# Altium schematic sheet 03.Communicate.SchDoc: 03.Communicate
size A4; Organization: Altium Limited; Address1: L3, 12a Rodborough Rd; Address2: Frenchs Forest; Address3: NSW; Address4: Australia 2086; Revision: V1; SheetNumber: 4; SheetTotal: 6; Project: CH32V307VCT6
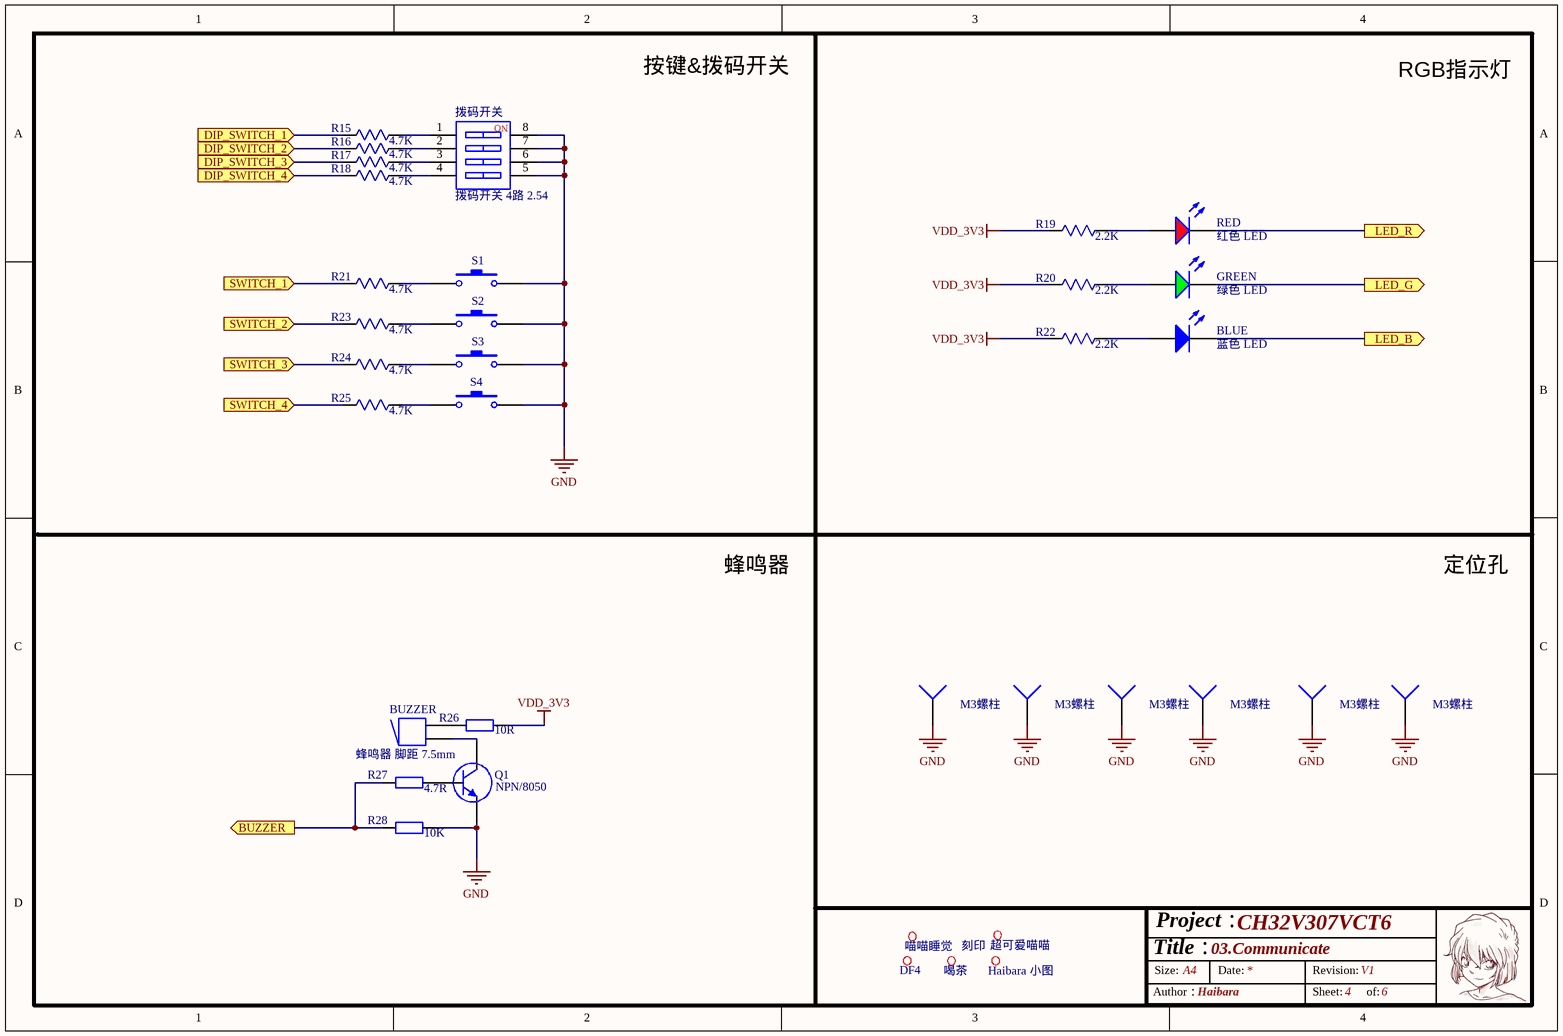
[diagram p0: 03.Communicate.SchDoc]

## Parts
(Parts that share a designator on the sheet are numbered #1, #2 ... from top to bottom, then left to right.)
?#1  喵喵睡觉  [喵喵睡觉]
?#2  超可爱喵喵  [喵喵]
?#3  刻印  [刻印]
?#4  DF4  [DF4小]
?#5  Haibara 小图  [Haibara小图丝印]
?#6  喝茶  [喝茶]
BLUE  蓝色 LED  [0603 LED B]
BUZZER  蜂鸣器 脚距 7.5mm  [蜂鸣器5.5mm脚距]
GREEN  绿色 LED  [0603 LED G]
J1  M3螺柱  [MTGP720H320V6P - duplicate]
J2  M3螺柱  [MTGP720H320V6P - duplicate]
J3  M3螺柱  [MTGP720H320V6P - duplicate]
J4  M3螺柱  [MTGP720H320V6P - duplicate]
J5  M3螺柱  [MTGP720H320V6P - duplicate]
J6  M3螺柱  [MTGP720H320V6P - duplicate]
Q1  NPN/8050  [SOT232-3 三极管]
R15  4.7K  [R0603]
R16  4.7K  [R0603]
R17  4.7K  [R0603]
R18  4.7K  [R0603]
R19  2.2K  [R0603]
R20  2.2K  [R0603]
R21  4.7K  [R0603]
R22  2.2K  [R0603]
R23  4.7K  [R0603]
R24  4.7K  [R0603]
R25  4.7K  [R0603]
R26  value 10R  [0603 电阻 R3]  (hidden comment: 4.7K)
R27  value 4.7R  [0603 电阻 R3]  (hidden comment: 4.7K)
R28  value 10K  [0603 电阻 R3]  (hidden comment: 4.7K)
RED  红色 LED  [0603 LED R]
S1  SW-PB  [TSW SMD-3*6*2.5]  (value not drawn)
S2  SW-PB  [TSW SMD-3*6*2.5]  (value not drawn)
S3  SW-PB  [TSW SMD-3*6*2.5]  (value not drawn)
S4  SW-PB  [TSW SMD-3*6*2.5]  (value not drawn)
拨码开关  拨码开关 4路 2.54  [CSW DIP-2P_G]

## Ports
BUZZER (out), DIP_SWITCH_1 (in), DIP_SWITCH_2 (in), DIP_SWITCH_3 (in), DIP_SWITCH_4 (in), LED_B (out), LED_G (out), LED_R (out), SWITCH_1 (in), SWITCH_2 (in), SWITCH_3 (in), SWITCH_4 (in)

## Nets
GND: J1.1 J2.1 J3.1 J4.1 J5.1 J6.1 Q1.2(E) R28.2 S1.2 S2.2 S3.2 S4.2 拨码开关.5 拨码开关.6 拨码开关.7 拨码开关.8
VDD_3V3: R19.1 R20.1 R22.1 R26.2
BUZZER: R27.1 R28.1 ; port BUZZER
DIP_SWITCH_1: R15.1 ; port DIP_SWITCH_1
DIP_SWITCH_2: R16.1 ; port DIP_SWITCH_2
DIP_SWITCH_3: R17.1 ; port DIP_SWITCH_3
DIP_SWITCH_4: R18.1 ; port DIP_SWITCH_4
LED_B: BLUE.2 ; port LED_B
LED_G: GREEN.2 ; port LED_G
LED_R: RED.2 ; port LED_R
SWITCH_1: R21.1 ; port SWITCH_1
SWITCH_2: R23.1 ; port SWITCH_2
SWITCH_3: R24.1 ; port SWITCH_3
SWITCH_4: R25.1 ; port SWITCH_4
NetBLUE_1: BLUE.1 R22.2
NetBUZZER_1: BUZZER.1 R26.1
NetBUZZER_2: BUZZER.2 Q1.3(C)
NetGREEN_1: GREEN.1 R20.2
NetQ1_1: Q1.1(B) R27.2
NetR15_2: R15.2 拨码开关.1
NetR16_2: R16.2 拨码开关.2
NetR17_2: R17.2 拨码开关.3
NetR18_2: R18.2 拨码开关.4
NetR19_2: R19.2 RED.1
NetR21_2: R21.2 S1.1
NetR23_2: R23.2 S2.1
NetR24_2: R24.2 S3.1
NetR25_2: R25.2 S4.1

## Notes on the sheet
- 按键&拨码开关
- RGB指示灯
- 蜂鸣器
- 定位孔
- Title：
- Size:
- Project：
- A4
- Date:
- Revision:
- Author：
- Haibara
- Sheet:
- of:
- (in symbol CSW-4P) NO

## Library data of the parts
BLUE = 蓝灯: 发光二极管; ComponentLink1Description: 供应商链接; ComponentLink1URL: http://www.szlcsc.com/product/details_2666.html; Package: 0805; Supplier: LC; SuppliersPartNumber: C2293
BUZZER = Buzzer: Magnetic Transducer Buzzer; Published: 24-Mar-1999; LatestRevisionDate: 17-Dec-2003; LatestRevisionNote: Schematic revised, PCB Footprint replaced.; DatasheetVersion: 17-Dec-2003; PackageReference: ABSM-1574; Publisher: Altium Limited; PackageDescription: Magnetic Transducer Buzzer; ComponentLink1Description: Manufacturer Link; ComponentLink1URL: http://www.megastar.com/linecard/buzzmode/index.php
GREEN = 绿灯: 发光二极管; ComponentLink1Description: 供应商链接; ComponentLink1URL: http://www.szlcsc.com/product/details_2670.html; Package: 0805; Supplier: LC; SuppliersPartNumber: C2297
J1-J6 = Socket: LatestRevisionDate: 17-Jul-2002; LatestRevisionNote: Re-released for DXP Platform.; Publisher: Altium Limited
R15-R25 = 电阻
R26-R28 = Res2: Resistor; Published: 8-Jun-2000; LatestRevisionDate: 17-Jul-2002; LatestRevisionNote: Re-released for DXP Platform.; PackageReference: AXIAL-0.4; Publisher: Altium Limited; PackageDescription: Axial Device, Thru-Hole; 2 Leads; 0.4 in Pin Spacing
RED = 红灯: 发光二极管; ComponentLink1Description: 供应商链接; ComponentLink1URL: http://www.szlcsc.com/product/details_2668.html; Package: 0805; Supplier: LC; SuppliersPartNumber: C2295
S1-S4 = SW-PB: Switch; Published: 24-Mar-1999; LatestRevisionDate: 17-Jul-2002; LatestRevisionNote: Re-released for DXP Platform.; PackageReference: SPST-2; Publisher: Altium Limited; PackageDescription: Switch; 2 Leads
拨码开关 = CSW-4P: 4路编码开关; 版权归属: 源创客; BOM名称: 4路编码开关; 学习资源: www.ooocke.com